# Altium schematic sheet JTAG.SchDoc
size A4; SheetNumber: 6; SheetTotal: 11
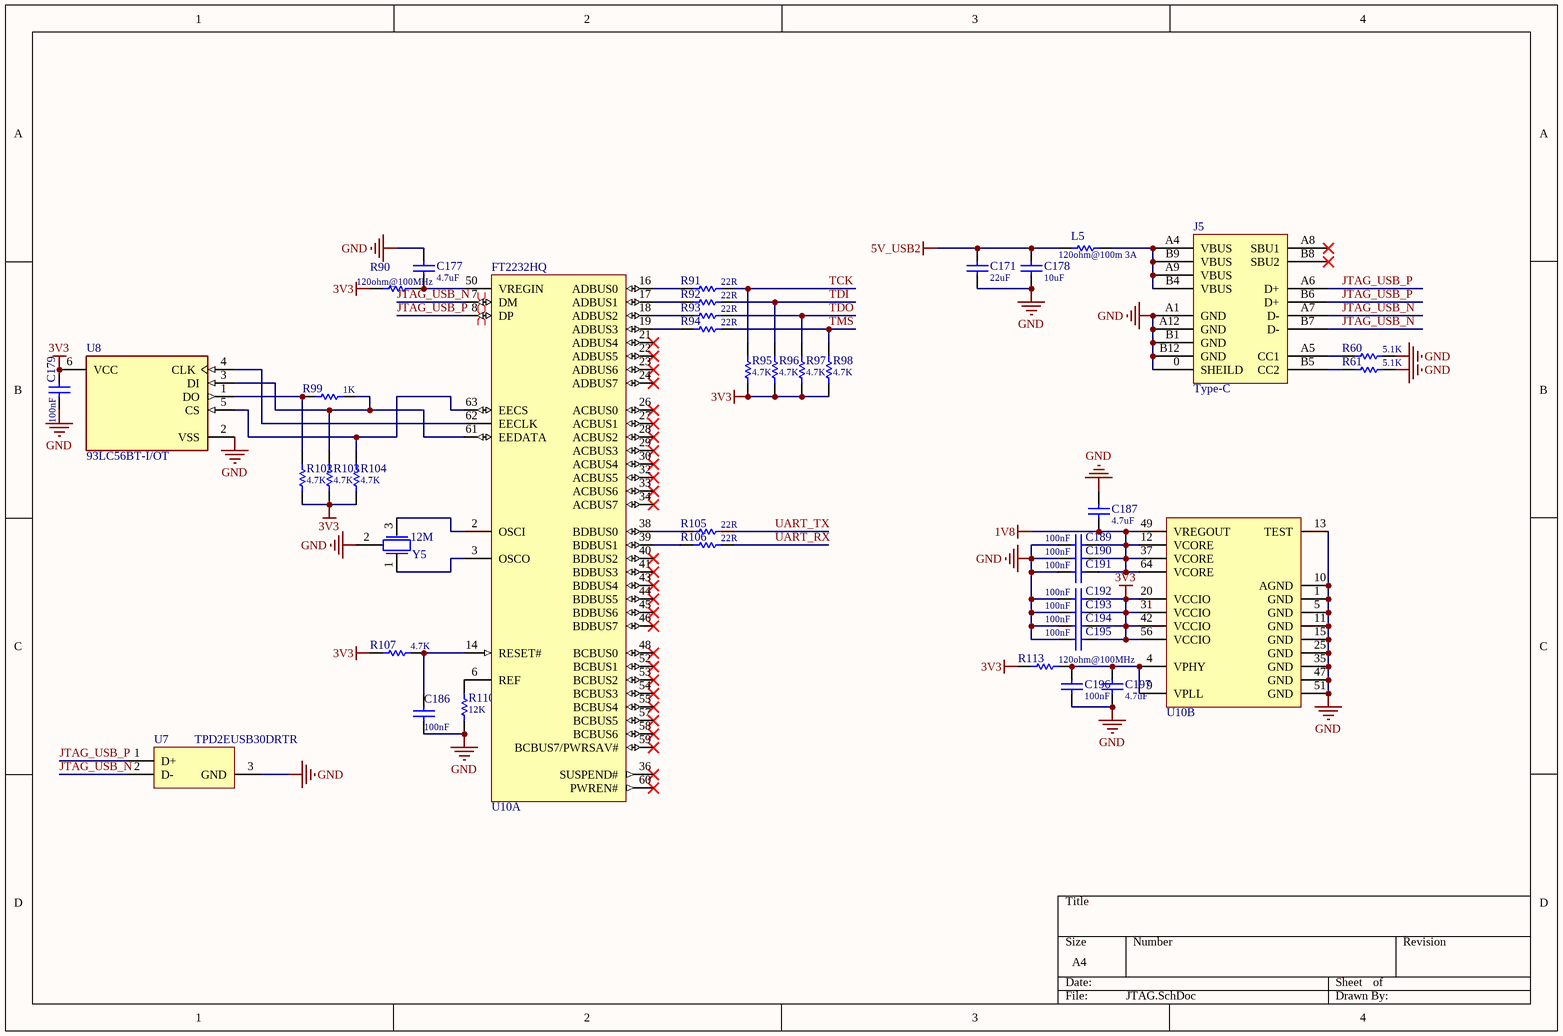
[diagram p0: JTAG.SchDoc]

## Parts
C171  value 22uF  [C0805-L]  (hidden comment: Cap-S)
C177  value 4.7uF  [C0402-L]  (hidden comment: Cap-S)
C178  value 10uF  [C0603-L]  (hidden comment: Cap-S)
C179  value 100nF  [C0402-L]  (hidden comment: Cap-S)
C186  value 100nF  [C0402-L]  (hidden comment: Cap-S)
C187  value 4.7uF  [C0402-L]  (hidden comment: Cap-S)
C189  value 100nF  [C0402-L]  (hidden comment: Cap-S)
C190  value 100nF  [C0402-L]  (hidden comment: Cap-S)
C191  value 100nF  [C0402-L]  (hidden comment: Cap-S)
C192  value 100nF  [C0402-L]  (hidden comment: Cap-S)
C193  value 100nF  [C0402-L]  (hidden comment: Cap-S)
C194  value 100nF  [C0402-L]  (hidden comment: Cap-S)
C195  value 100nF  [C0402-L]  (hidden comment: Cap-S)
C196  value 100nF  [C0402-L]  (hidden comment: Cap-S)
C197  value 4.7uF  [C0402-L]  (hidden comment: Cap-S)
J5  Type-C  [TYPE-C]
L5  value 120ohm@100m 3A  [R0805-L]  (hidden comment: R)
R60  value 5.1K  [R0402-L]  (hidden comment: R)
R61  value 5.1K  [R0402-L]  (hidden comment: R)
R90  value 120ohm@100MHz  [R0402-L]  (hidden comment: R)
R91  value 22R  [R0402-L]  (hidden comment: R)
R92  value 22R  [R0402-L]  (hidden comment: R)
R93  value 22R  [R0402-L]  (hidden comment: R)
R94  value 22R  [R0402-L]  (hidden comment: R)
R95  value 4.7K  [R0402-L]  (hidden comment: R)
R96  value 4.7K  [R0402-L]  (hidden comment: R)
R97  value 4.7K  [R0402-L]  (hidden comment: R)
R98  value 4.7K  [R0402-L]  (hidden comment: R)
R99  value 1K  [R0402-L]  (hidden comment: R)
R102  value 4.7K  [R0402-L]  (hidden comment: R)
R103  value 4.7K  [R0402-L]  (hidden comment: R)
R104  value 4.7K  [R0402-L]  (hidden comment: R)
R105  value 22R  [R0402-L]  (hidden comment: R)
R106  value 22R  [R0402-L]  (hidden comment: R)
R107  value 4.7K  [R0402-L]  (hidden comment: R)
R110  value 12K  [R0402-L]  (hidden comment: R)
R113  value 120ohm@100MHz  [R0402-L]  (hidden comment: R)
U7  TPD2EUSB30DRTR  [DRT0003A]
U8  93LC56BT-I/OT  [FP-C04-028-MFG]
U10  FT2232HQ  [QFN50P900X900X90-65N-D]  (parts A,B of 2)
Y5  12M  [XTAL-3Pin]

## Nets
1V8: C187.2 C189.2 C190.2 C191.2 U10.12(VCORE) U10.37(VCORE) U10.49(VREGOUT) U10.64(VCORE)
3V3: C179.2 C192.2 C193.2 C194.2 C195.2 R90.2 R95.2 R96.2 R97.2 R98.2 R102.2 R103.2 R104.2 R107.2 R113.2 U8.6(VCC) U10.20(VCCIO) U10.31(VCCIO) U10.42(VCCIO) U10.56(VCCIO)
5V_USB2: C171.1 C178.1 L5.1
GND: C171.2 C177.1 C178.2 C179.1 C186.1 C187.1 C189.1 C190.1 C191.1 C192.1 C193.1 C194.1 C195.1 C196.1 C197.2 J5.0(SHEILD) J5.A1(GND) J5.A12(GND) J5.B1(GND) J5.B12(GND) R60.1 R61.1 R110.1 U7.3(GND) U8.2(VSS) U10.1(GND) U10.5(GND) U10.10(AGND) U10.11(GND) U10.13(TEST) U10.15(GND) U10.25(GND) U10.35(GND) U10.47(GND) U10.51(GND) Y5.2
JTAG_USB_N: J5.A7(D-) J5.B7(D-) U7.2(D-) U10.7(DM)
JTAG_USB_P: J5.A6(D+) J5.B6(D+) U7.1(D+) U10.8(DP)
TCK: R91.1 R95.1
TDI: R92.1 R96.1
TDO: R93.1 R97.1
TMS: R94.1 R98.1
UART_RX: R106.1
UART_TX: R105.1
NetC177_2: C177.2 R90.1 U10.50(VREGIN)
NetC186_2: C186.2 R107.1 U10.14(RESET#)
NetC196_2: C196.2 C197.1 R113.1 U10.4(VPHY) U10.9(VPLL)
NetJ5_A4: J5.A4(VBUS) J5.A9(VBUS) J5.B4(VBUS) J5.B9(VBUS) L5.2
NetJ5_A5: J5.A5(CC1) R60.2
NetJ5_B5: J5.B5(CC2) R61.2
NetR91_2: R91.2 U10.16(ADBUS0)
NetR92_2: R92.2 U10.17(ADBUS1)
NetR93_2: R93.2 U10.18(ADBUS2)
NetR94_2: R94.2 U10.19(ADBUS3)
NetR99_1: R99.1 R103.1 U8.3(DI) U10.61(EEDATA)
NetR99_2: R99.2 R102.1 U8.1(DO)
NetR104_1: R104.1 U8.5(CS) U10.63(EECS)
NetR105_2: R105.2 U10.38(BDBUS0)
NetR106_2: R106.2 U10.39(BDBUS1)
NetR110_2: R110.2 U10.6(REF)
NetU8_4: U8.4(CLK) U10.62(EECLK)
NetU10_2: U10.2(OSCI) Y5.3
NetU10_3: U10.3(OSCO) Y5.1

Not connected (* = marked no-connect by the designer): J5 A8(SBU1)* B8(SBU2)*; U10 21(ADBUS4)* 22(ADBUS5)* 23(ADBUS6)* 24(ADBUS7)* 26(ACBUS0)* 27(ACBUS1)* 28(ACBUS2)* 29(ACBUS3)* 30(ACBUS4)* 32(ACBUS5)* 33(ACBUS6)* 34(ACBUS7)* 36(SUSPEND#)* 40(BDBUS2)* 41(BDBUS3)* 43(BDBUS4)* 44(BDBUS5)* 45(BDBUS6)* 46(BDBUS7)* 48(BCBUS0)* 52(BCBUS1)* 53(BCBUS2)* 54(BCBUS3)* 55(BCBUS4)* 57(BCBUS5)* 58(BCBUS6)* 59(BCBUS7/PWRSAV#)* 60(PWREN#)*

## Layout directives
differential pair: JTAG_USB_N, JTAG_USB_P

## Library data of the parts
C171 C177-C179 C186 C187 C189-C197 = Cap-S: 贴片瓷片电容
L5 R60 R61 R90-R99 R102-R107 R110 R113 = Res: 贴片电阻
U7 = CMP-0326-00046-3: ESD Solution for Super-Speed (6 Gbps) USB 3.0 Interface, 2 Channels, -40 to +85 degC, 3-pin SOT (DRT), Green (Rohs & No Sb/Br); Manufacturer: Texas Instruments; Differential Capacitance(pF): 0.01; Breakdown Voltage(Min)(V): 9; HDMI: TRUE; IEC 61000-4-2 Air-Gap(+/- kV): 8; IO Leakage Current(nA): 10; IO Capacitance(Typ)(pF): 0.7; Mounting Technology: Surface Mount; PackageDescription: 3-Flat Lead Plastic Small Outline, 1 x 1 mm (inc leads), 0.35 mm Pitch; IEC 61000-4-2 Contact(+/- kV): 8; USB Super Speed: TRUE; Eco-Plan: Green (RoHS & no Sb/Br); USB High Speed: TRUE; PackageReference: DRT0003A; SubFamily: ESD Solution; USB Full Speed: TRUE; ComponentLink1Description: Datasheet; ComponentLink2URL: SamplesURL:http://www.ti.com/product/tpd2eusb30#samples; PackageVersion: revD, Jun-2008; ComponentLink2Description: URL Link1; 1394 / Firewire: TRUE; PartNumber: TPD2EUSB30DRTR; ComponentLink1URL: http://www.ti.com/general/docs/lit/getliterature.tsp?genericPartNumber=TPD2EUSB30&fileType=pdf; DatasheetVersion: SLVSAC2C; Serial ATA / eSATA: TRUE
U8 = CMP-0162-00356-2: IC EEPROM 2K SPI 2MHZ SOT23-6; Access Time: 250ns; Density: 2Kb; Max Supply Voltage: 5.5V; Interface: Serial; Min Supply Voltage: 2.5V; Nominal Supply Current: 2mA; Number of Pins: 6; Radiation Hardening: No; Length: 3.1mm; Height: 1.3mm; Min Operating Temperature: -40°C; Max Operating Temperature: 85°C; Lead Free: Lead Free; Memory Type: EEPROM; Contact Plating: Tin; REACH SVHC: No SVHC; Package Quantity: 3000; Frequency: 2MHz; Width: 1.8mm; Max Frequency: 2MHz; Case/Package: SOT-23; Mount: Surface Mount; Packaging: Tape and Reel; Memory Size: 2Kb
U10 = FT2232HQ: Dual High Speed USB to Multipurpose UART / FIFO IC / , 3 to 3.6 V, -40 to 85 degC, 64- Pin LQFP, RoHS; Manufacturer: FTDI; Number of Channels per Chip: 2; Standard Supported: RS232,RS422,RS485; Maximum Data Rate: 480Mbit/s; Package Description: 64-Pin Low-profile Quad Flat Package, Body 10 x 10 mm, Pitch 0.5 mm; Maximum Operating Temperature: +85°C; Mounting Technology: SurfaceMount; Pin Count: 64; Package Reference: LQFP-64; Manufacturer URL: http://www.nxp.com/; Length: 10mm; Width: 10mm; Minimum Operating Temperature: -40°C; Dimensions: 10x10x1.4mm; Package Type: LQFP; Mounting Type: SurfaceMount; Datasheet URL: http://www.ftdichip.com/Support/Documents/DataSheets/ICs/DS_FT2232H.pdf; Datasheet Version: Rev. 2.5, 07/2016; Height: 1.4mm
Y5 = XTAL-3PIN: 贴片晶振